# Altium schematic sheet 000_Hierarchical.SchDoc: HIERARCHICAL system
size A4; Date: xxxxxx; DrawnBy: H.Y.Pabón; Revision: R1V0; SheetNumber: 1; SheetTotal: 4
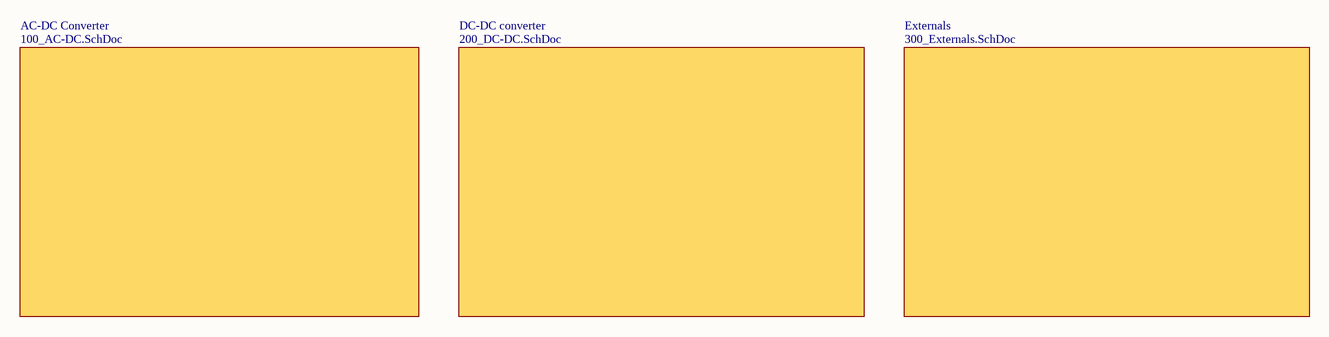
[diagram p0: 000_Hierarchical.SchDoc]

## Sub-sheets
AC-DC Converter = 100_AC-DC.SchDoc: no entries
DC-DC converter = 200_DC-DC.SchDoc: no entries
Externals = 300_Externals.SchDoc: no entries

## Notes on the sheet
- Title:
- Project:
- File:
- Revision:
- Date:
- Size:
- A4
- Drawn by: